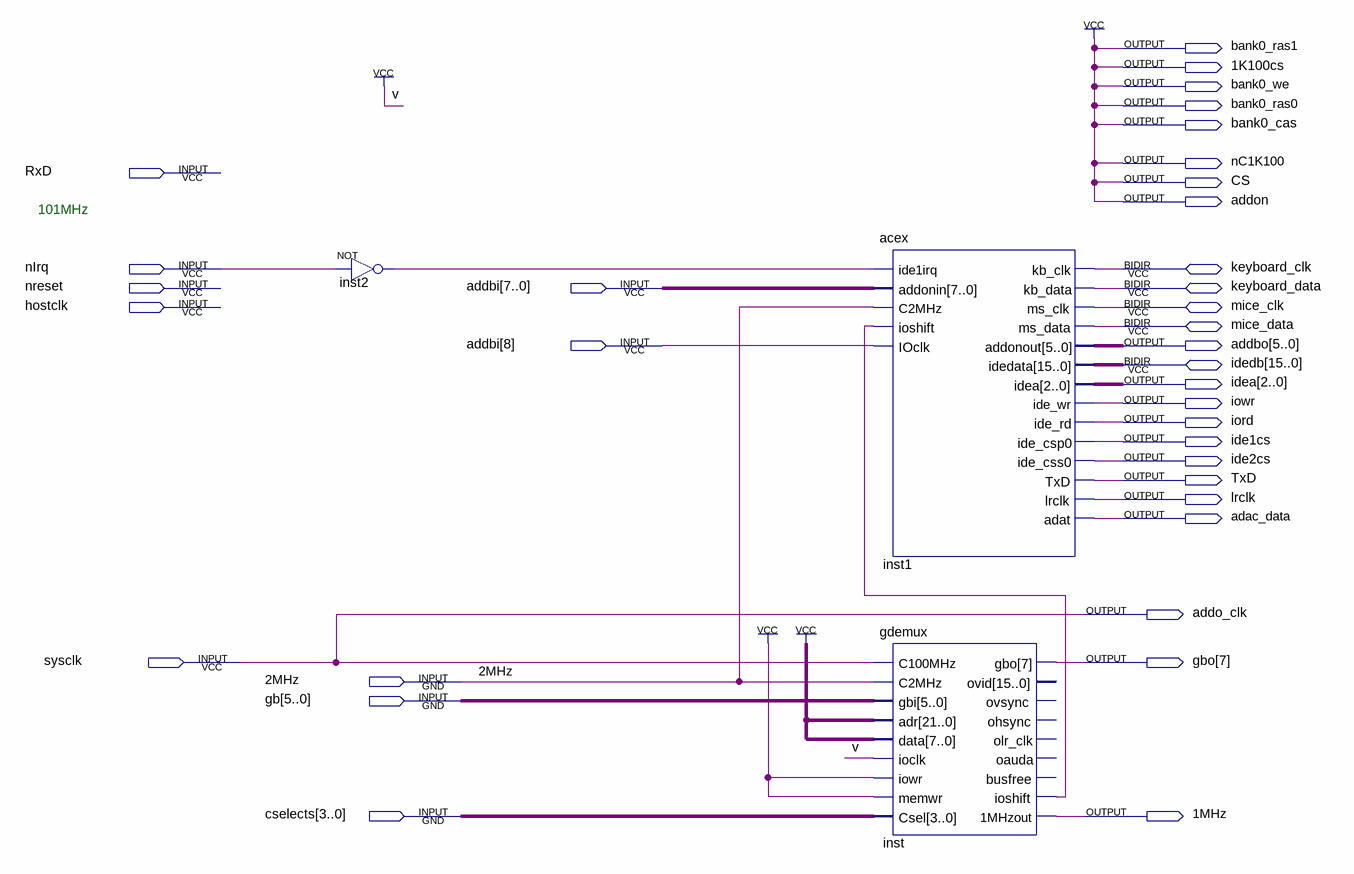
[diagram p0: schematic sheet]
// Quartus schematic bbfast.bdf as structural Verilog: 3 symbols, 35 pins
module bbfast (
  input  RxD,
  input  nIrq,
  input  nreset,
  input  [8:0] addbi,
  input  hostclk,
  input  sysclk,
  input  \2MHz ,
  input  [5:0] gb,
  input  [3:0] cselects,
  inout  keyboard_clk,
  inout  keyboard_data,
  inout  mice_clk,
  inout  mice_data,
  inout  [15:0] idedb,
  output bank0_ras1,
  output \1K100cs ,
  output bank0_we,
  output bank0_ras0,
  output bank0_cas,
  output nC1K100,
  output CS,
  output addon,
  output [5:0] addbo,
  output [2:0] idea,
  output iowr,
  output iord,
  output ide1cs,
  output ide2cs,
  output TxD,
  output lrclk,
  output adac_data,
  output addo_clk,
  output [7:7] gbo,
  output \1MHz 
);

  wire inst2_out, inst_ioshift;

  not inst2 (inst2_out, nIrq);
  acex inst1 (
    .ide1irq(inst2_out), .addonin(addbi[7:0]), .C2MHz(\2MHz ), .ioshift(inst_ioshift), .IOclk(addbi[8]),
    .addonout(addbo), .idea(idea), .ide_wr(iowr), .ide_rd(iord), .ide_csp0(ide1cs), .ide_css0(ide2cs),
    .TxD(TxD), .lrclk(lrclk), .adat(adac_data), .kb_clk(keyboard_clk), .kb_data(keyboard_data),
    .ms_clk(mice_clk), .ms_data(mice_data), .idedata(idedb));
  gdemux inst (
    .C100MHz(sysclk), .C2MHz(\2MHz ), .gbi(gb), .adr({22{1'b1}}), .data({22{1'b1}}), .ioclk(1'b1),
    .iowr(1'b1), .memwr(1'b1), .Csel(cselects), .gbo(gbo[7]), .ioshift(inst_ioshift), .\1MHzout (\1MHz ));  // open: ovid, ovsync, ohsync, olr_clk, oauda, busfree

  assign \1K100cs  = 1'b1;
  assign addo_clk = sysclk;
  assign addon = 1'b1;
  assign bank0_cas = 1'b1;
  assign bank0_ras0 = 1'b1;
  assign bank0_ras1 = 1'b1;
  assign bank0_we = 1'b1;
  assign CS = 1'b1;
  assign nC1K100 = 1'b1;

  // Notes on the sheet:
  //   101MHz
endmodule
